# Altium schematic sheet FPGA.SchDoc
size 297 x 209 mm
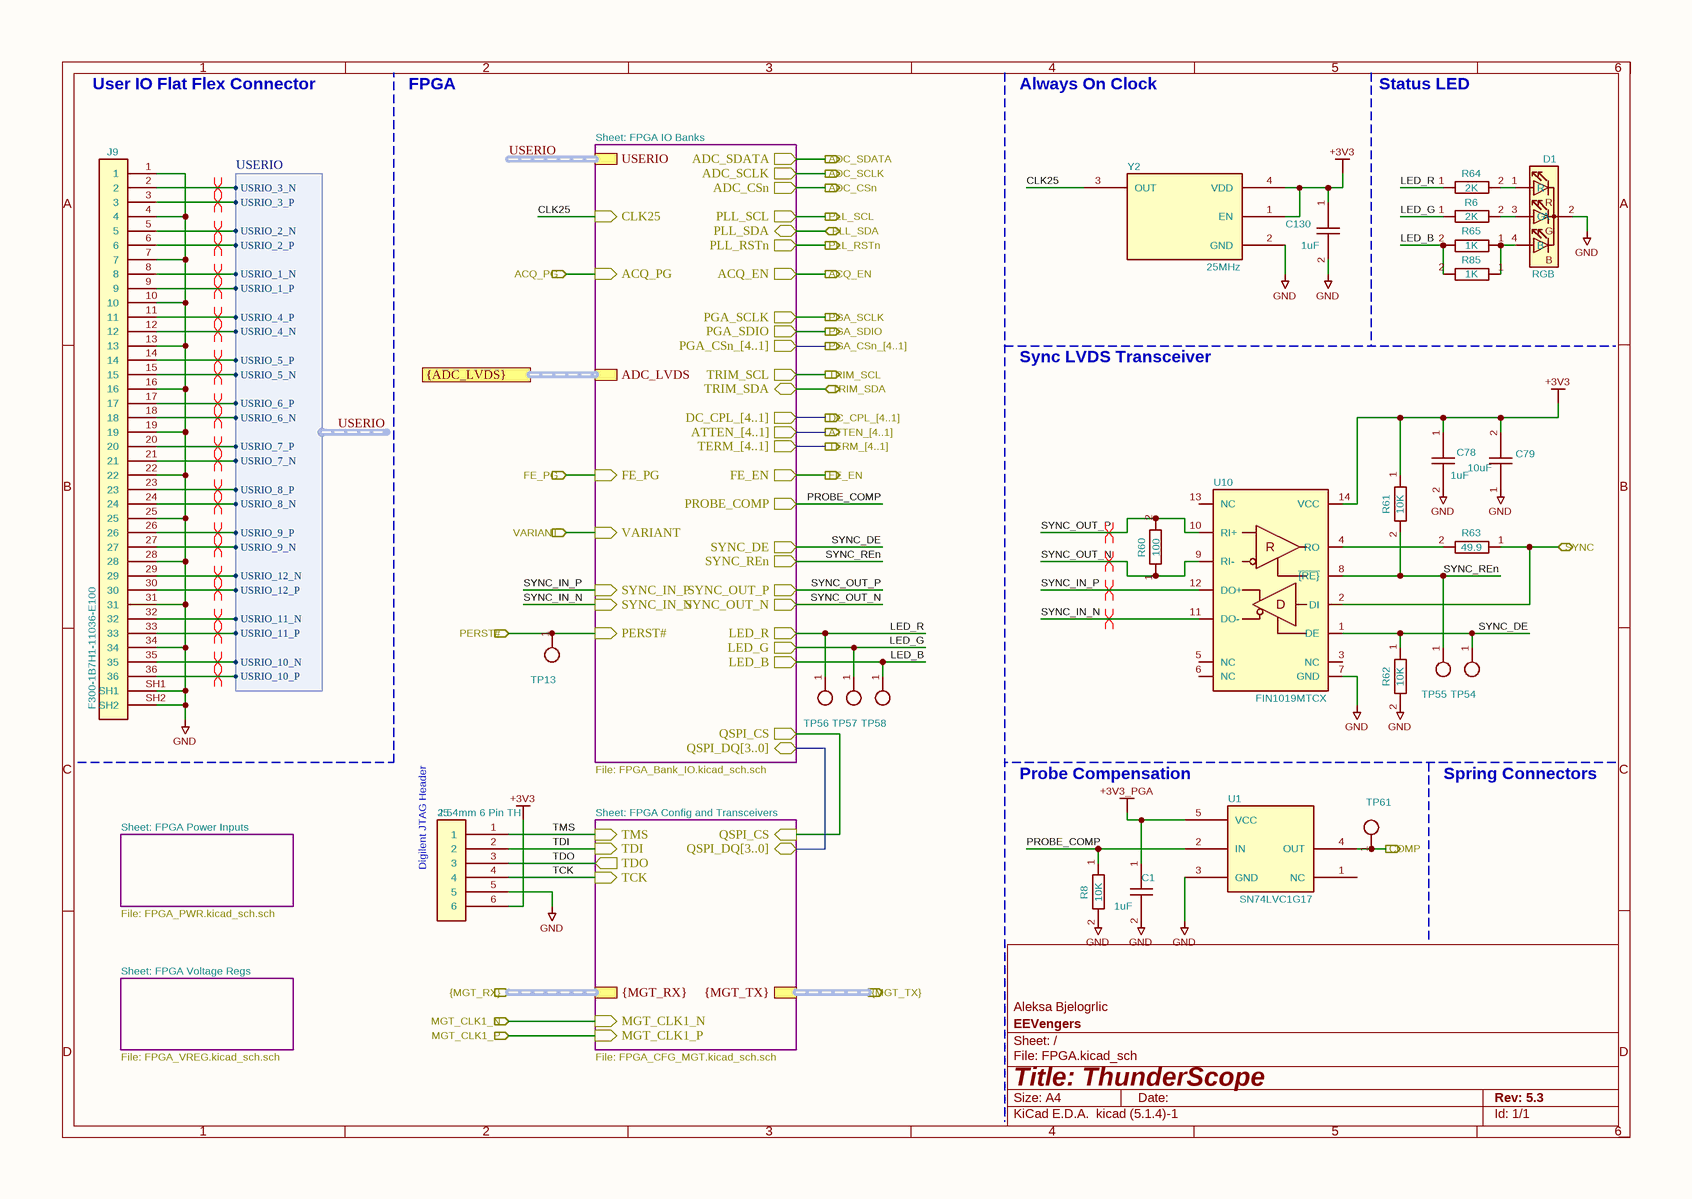
[diagram p0: FPGA.SchDoc]

## Parts
C1  1uF  [GEN_C_0402]
C78  1uF  [GEN_C_0402]
C79  10uF  [GEN_C_0603]
C130  1uF  [GEN_C_0402]
D1  RGB  [LED_Kingbright_APFA3010_3x1.5mm_Horizontal]
J5  2.54mm 6 Pin TH  [GEN_1.27MM_6_PIN_TH_RA]
J9  F300-1B7H1-11036-E100  [AMPHENOL_F300-1B7H1-11036-E100]
R6  2K  [GEN_R_0402]
R8  10K  [GEN_R_0402]
R60  100  [GEN_R_0402]
R61  10K  [GEN_R_0402]
R62  10K  [GEN_R_0402]
R63  49.9  [GEN_R_0402]
R64  2K  [GEN_R_0402]
R65  1K  [GEN_R_0402]
R85  1K  [GEN_R_0402]
TP13  PCB  [GEN_TP_PCB]  (value not drawn)
TP54  PCB  [GEN_TP_PCB]  (value not drawn)
TP55  PCB  [GEN_TP_PCB]  (value not drawn)
TP56  PCB  [GEN_TP_PCB]  (value not drawn)
TP57  PCB  [GEN_TP_PCB]  (value not drawn)
TP58  PCB  [GEN_TP_PCB]  (value not drawn)
TP61  PCB  [GEN_TP_PCB]  (value not drawn)
U1  SN74LVC1G17  [GEN_SC-70-5]
U10  FIN1019MTCX  [GEN_TSSOP-14_4.4x5mm_P0.65mm]
Y2  25MHz  [ECS_TXO-2016]

## Sub-sheets
FPGA Config and Transceivers = FPGA_CFG_MGT.SchDoc: TDI (in), TDO (out), TCK (in), TMS (in), QSPI_DQ[3..0] (bidir), QSPI_CS (in), MGT_CLK1_N (in), MGT_CLK1_P (in), {MGT_RX} (harness MGT_RX), {MGT_TX} (harness MGT_TX)
FPGA IO Banks = FPGA_Bank_IO.SchDoc: FE_EN (out), PROBE_COMP (out), PLL_RSTn (out), ATTEN_[4..1] (out), TERM_[4..1] (out), DC_CPL_[4..1] (out), PGA_CSn_[4..1] (out), ADC_CSn (out), PERST# (in), ADC_SDATA (out), ADC_SCLK (out), PLL_SCL (out), PLL_SDA (bidir), ACQ_EN (out), PGA_SCLK (out), PGA_SDIO (out), TRIM_SCL (out), TRIM_SDA (bidir), SYNC_OUT_N (out), SYNC_OUT_P (out), SYNC_IN_P (in), SYNC_IN_N (in), FE_PG (in), ACQ_PG (in), SYNC_DE (out), SYNC_REn (out), LED_R (out), LED_G (out), LED_B (out), CLK25 (in), QSPI_CS (out), QSPI_DQ[3..0] (bidir), VARIANT (in), USERIO (harness USERIO), ADC_LVDS (harness ADC_LVDS)
FPGA Power Inputs = FPGA_PWR.SchDoc: no entries
FPGA Voltage Regs = FPGA_VREG.SchDoc: no entries

## Ports
ACQ_EN (out), ACQ_PG (in), ADC_CSn (out), ADC_SCLK (out), ADC_SDATA (out), ATTEN_[4..1] (out), COMP (out), DC_CPL_[4..1] (out), FE_EN (out), FE_PG (in), MGT_CLK1_N (in), MGT_CLK1_P (in), PERST# (in), PGA_CSn_[4..1] (out), PGA_SCLK (out), PGA_SDIO (out), PLL_RSTn (out), PLL_SCL (out), PLL_SDA (bidir), SYNC (bidir), TERM_[4..1] (out), TRIM_SCL (out), TRIM_SDA (bidir), VARIANT (in), {ADC_LVDS}, {MGT_RX} (in), {MGT_TX} (out)

## Harnesses
USERIO: USRIO_1_P, USRIO_1_N, USRIO_2_P, USRIO_2_N, USRIO_3_P, USRIO_3_N, USRIO_4_P, USRIO_4_N, USRIO_5_P, USRIO_5_N, USRIO_6_P, USRIO_6_N, USRIO_7_P, USRIO_7_N, USRIO_8_P, USRIO_8_N, USRIO_9_P, USRIO_9_N, USRIO_10_P, USRIO_10_N, USRIO_11_P, USRIO_11_N, USRIO_12_P, USRIO_12_N

## Nets
+3V3: C78.1 C79.2 C130.1 J5.6 R61.1 U10.14(VCC) Y2.1(EN) Y2.4(VDD)
+3V3_PGA: C1.1 U1.5(VCC)
GND: C1.2 C78.2 C79.1 C130.2 D1.2(A) J5.5 J9.1 J9.4 J9.7 J9.10 J9.13 J9.16 J9.19 J9.22 J9.25 J9.28 J9.31 J9.34 J9.SH1 J9.SH2 R8.2 R62.2 U1.3(GND) U10.7(GND) Y2.2(GND)
ACQ_EN: port ACQ_EN, sheet FPGA IO Banks/ACQ_EN
ACQ_PG: port ACQ_PG, sheet FPGA IO Banks/ACQ_PG
ADC_CSn: port ADC_CSn, sheet FPGA IO Banks/ADC_CSn
ADC_SCLK: port ADC_SCLK, sheet FPGA IO Banks/ADC_SCLK
ADC_SDATA: port ADC_SDATA, sheet FPGA IO Banks/ADC_SDATA
CLK25: Y2.3(OUT) ; sheet FPGA IO Banks/CLK25
COMP: TP61.1 U1.4(OUT) ; port COMP
FE_EN: port FE_EN, sheet FPGA IO Banks/FE_EN
FE_PG: port FE_PG, sheet FPGA IO Banks/FE_PG
LED_B: R65.2 R85.2 TP58.1 ; sheet FPGA IO Banks/LED_B
LED_G: R6.1 TP57.1 ; sheet FPGA IO Banks/LED_G
LED_R: R64.1 TP56.1 ; sheet FPGA IO Banks/LED_R
MGT_CLK1_N: port MGT_CLK1_N, sheet FPGA Config and Transceivers/MGT_CLK1_N
MGT_CLK1_P: port MGT_CLK1_P, sheet FPGA Config and Transceivers/MGT_CLK1_P
PERST#: TP13.1 ; port PERST#, sheet FPGA IO Banks/PERST#
PGA_SCLK: port PGA_SCLK, sheet FPGA IO Banks/PGA_SCLK
PGA_SDIO: port PGA_SDIO, sheet FPGA IO Banks/PGA_SDIO
PLL_RSTn: port PLL_RSTn, sheet FPGA IO Banks/PLL_RSTn
PLL_SCL: port PLL_SCL, sheet FPGA IO Banks/PLL_SCL
PLL_SDA: port PLL_SDA, sheet FPGA IO Banks/PLL_SDA
PROBE_COMP: R8.1 U1.2(IN) ; sheet FPGA IO Banks/PROBE_COMP
SYNC: R63.1 U10.2(DI) ; port SYNC
SYNC_DE: R62.1 TP54.1 U10.1(DE) ; sheet FPGA IO Banks/SYNC_DE
SYNC_IN_N: U10.11(DO-) ; sheet FPGA IO Banks/SYNC_IN_N
SYNC_IN_P: U10.12(DO+) ; sheet FPGA IO Banks/SYNC_IN_P
SYNC_OUT_N: R60.1 U10.9(RI-) ; sheet FPGA IO Banks/SYNC_OUT_N
SYNC_OUT_P: R60.2 U10.10(RI+) ; sheet FPGA IO Banks/SYNC_OUT_P
SYNC_REn: R61.2 TP55.1 U10.8(~{{RE}}) ; sheet FPGA IO Banks/SYNC_REn
TCK: J5.4 ; sheet FPGA Config and Transceivers/TCK
TDI: J5.2 ; sheet FPGA Config and Transceivers/TDI
TDO: J5.3 ; sheet FPGA Config and Transceivers/TDO
TMS: J5.1 ; sheet FPGA Config and Transceivers/TMS
TRIM_SCL: port TRIM_SCL, sheet FPGA IO Banks/TRIM_SCL
TRIM_SDA: port TRIM_SDA, sheet FPGA IO Banks/TRIM_SDA
USERIO.USRIO_1_N: J9.8 ; sheet FPGA IO Banks/USERIO.USRIO_1_N
USERIO.USRIO_1_P: J9.9 ; sheet FPGA IO Banks/USERIO.USRIO_1_P
USERIO.USRIO_2_N: J9.5 ; sheet FPGA IO Banks/USERIO.USRIO_2_N
USERIO.USRIO_2_P: J9.6 ; sheet FPGA IO Banks/USERIO.USRIO_2_P
USERIO.USRIO_3_N: J9.2 ; sheet FPGA IO Banks/USERIO.USRIO_3_N
USERIO.USRIO_3_P: J9.3 ; sheet FPGA IO Banks/USERIO.USRIO_3_P
USERIO.USRIO_4_N: J9.12 ; sheet FPGA IO Banks/USERIO.USRIO_4_N
USERIO.USRIO_4_P: J9.11 ; sheet FPGA IO Banks/USERIO.USRIO_4_P
USERIO.USRIO_5_N: J9.15 ; sheet FPGA IO Banks/USERIO.USRIO_5_N
USERIO.USRIO_5_P: J9.14 ; sheet FPGA IO Banks/USERIO.USRIO_5_P
USERIO.USRIO_6_N: J9.18 ; sheet FPGA IO Banks/USERIO.USRIO_6_N
USERIO.USRIO_6_P: J9.17 ; sheet FPGA IO Banks/USERIO.USRIO_6_P
USERIO.USRIO_7_N: J9.21 ; sheet FPGA IO Banks/USERIO.USRIO_7_N
USERIO.USRIO_7_P: J9.20 ; sheet FPGA IO Banks/USERIO.USRIO_7_P
USERIO.USRIO_8_N: J9.24 ; sheet FPGA IO Banks/USERIO.USRIO_8_N
USERIO.USRIO_8_P: J9.23 ; sheet FPGA IO Banks/USERIO.USRIO_8_P
USERIO.USRIO_9_N: J9.27 ; sheet FPGA IO Banks/USERIO.USRIO_9_N
USERIO.USRIO_9_P: J9.26 ; sheet FPGA IO Banks/USERIO.USRIO_9_P
USERIO.USRIO_10_N: J9.35 ; sheet FPGA IO Banks/USERIO.USRIO_10_N
USERIO.USRIO_10_P: J9.36 ; sheet FPGA IO Banks/USERIO.USRIO_10_P
USERIO.USRIO_11_N: J9.32 ; sheet FPGA IO Banks/USERIO.USRIO_11_N
USERIO.USRIO_11_P: J9.33 ; sheet FPGA IO Banks/USERIO.USRIO_11_P
USERIO.USRIO_12_N: J9.29 ; sheet FPGA IO Banks/USERIO.USRIO_12_N
USERIO.USRIO_12_P: J9.30 ; sheet FPGA IO Banks/USERIO.USRIO_12_P
VARIANT: port VARIANT, sheet FPGA IO Banks/VARIANT
NetD1_1: D1.1(R) R64.2
NetD1_3: D1.3(G) R6.2
NetD1_4: D1.4(B) R65.1 R85.1
NetR63_2: R63.2 U10.4(RO)
(unnamed): sheet FPGA IO Banks/QSPI_CS, sheet FPGA Config and Transceivers/QSPI_CS

Not connected (* = marked no-connect by the designer): U1 1(NC); U10 3(NC) 5(NC) 6(NC) 13(NC)

## Buses and harness runs
bus port ATTEN_[4..1] = sheet FPGA IO Banks/ATTEN_[4..1]
bus port DC_CPL_[4..1] = sheet FPGA IO Banks/DC_CPL_[4..1]
bus port PGA_CSn_[4..1] = sheet FPGA IO Banks/PGA_CSn_[4..1]
bus port TERM_[4..1] = sheet FPGA IO Banks/TERM_[4..1]
bus sheet FPGA Config and Transceivers/QSPI_DQ[3..0] = sheet FPGA IO Banks/QSPI_DQ[3..0]
harness port {ADC_LVDS} = sheet FPGA IO Banks/ADC_LVDS
harness port {MGT_RX} = sheet FPGA Config and Transceivers/{MGT_RX}
harness port {MGT_TX} = sheet FPGA Config and Transceivers/{MGT_TX}
harness USERIO = sheet FPGA IO Banks/USERIO

## Layout directives
differential pair: SYNC_IN_N, SYNC_IN_P, SYNC_OUT_N, SYNC_OUT_P
differential pair; differential pair class USERIO: USERIO.USRIO_1_N, USERIO.USRIO_1_P, USERIO.USRIO_2_N, USERIO.USRIO_2_P, USERIO.USRIO_3_N, USERIO.USRIO_3_P, USERIO.USRIO_4_N, USERIO.USRIO_4_P, USERIO.USRIO_5_N, USERIO.USRIO_5_P, USERIO.USRIO_6_N, USERIO.USRIO_6_P, USERIO.USRIO_7_N, USERIO.USRIO_7_P, USERIO.USRIO_8_N, USERIO.USRIO_8_P, USERIO.USRIO_9_N, USERIO.USRIO_9_P, USERIO.USRIO_10_N, USERIO.USRIO_10_P, USERIO.USRIO_11_N, USERIO.USRIO_11_P, USERIO.USRIO_12_N, USERIO.USRIO_12_P

## Notes on the sheet
- User IO Flat Flex Connector
- FPGA
- Sheet: FPGA IO Banks
- Always On Clock
- Status LED
- Sync LVDS Transceiver
- File: FPGA_Bank_IO.kicad_sch.sch
- Probe Compensation
- Spring Connectors
- Sheet: FPGA Power Inputs
- Sheet: FPGA Config and Transceivers
- File: FPGA_PWR.kicad_sch.sch
- (near J5) Digilent JTAG Header
- Sheet: FPGA Voltage Regs
- File: FPGA_VREG.kicad_sch.sch
- File: FPGA_CFG_MGT.kicad_sch.sch
- 1
- 2
- 3
- 4
- 5
- 6
- A
- B
- C
- Aleksa Bjelogrlic
- D
- Title: ThunderScope
- File: FPGA.kicad_sch
- Sheet: /
- EEVengers
- KiCad E.D.A.  kicad (5.1.4)-1
- Size: A4
- Date:
- Rev: 5.3
- Id: 1/1
- (in symbol IC LVDS XCVR FIN1019MTCX) R; D

## Library data of the parts
C1 C78 C130 = CAP 1uF 25V X5R 0402: MANUFACTURER: Murata; MANUFACTURER PART NUMBER: GRM155R61E105KA12D; VOLTAGE RATING: 25V; Substitutions Policy: Any Parametric Equivalent; PACKAGE: 0402; SUPPLIER 1: Mouser; SUPPLIER PART NUMBER 1: 81-GRM155R61E105KA2D; Footprint: Thunderscope_Rev5:GEN_C_0402; Value: 1uF
C79 = CAP 10uF 25V X5R 0603: MANUFACTURER: Murata; MANUFACTURER PART NUMBER: GRM188R61E106MA73D; VOLTAGE RATING: 25V; Substitutions Policy: Any Parametric Equivalent; PACKAGE: 0402; SUPPLIER 1: Mouser; SUPPLIER PART NUMBER 1: 81-GRM188R61E106MA3D; Footprint: Thunderscope_Rev5:GEN_C_0603; Value: 10uF
D1 = LED RGB 1204 APFA3010LSEKJ3ZGKQBC: A-SP1103R6GHB1W-A01-2C; MANUFACTURER: Kingbright; Substitutions Policy: ECO Required for Substitution; SUPPLIER 1: Mouser; SUPPLIER PART NUMBER 1: 604-APFA3010LSEKJ3ZG; MANUFACTURER PART NUMBER: APFA3010LSEKJ3ZGKQBC; PACKAGE: 4-SMD; Value: RGB; Footprint: Thunderscope_Rev5:LED_Kingbright_APFA3010_3x1.5mm_Horizontal
J5 = CONN 2.54mm 6 Pin TH RA: MANUFACTURER: Wurth Electronics; MANUFACTURER PART NUMBER: 61300611021; Substitutions Policy: ECO Required for Substitution; SUPPLIER 1: Mouser; SUPPLIER PART NUMBER 1: 710-61300611021; PACKAGE: Through Hole; Value: 2.54mm 6 Pin TH; Footprint: Thunderscope_Rev5:GEN_2.54MM_6_PIN_TH_RA
J9 = CONN FFC BOTTOM 36POS 0.5MM RA: MANUFACTURER: Amphenol ICC; Substitutions Policy: No Substitutions; SUPPLIER 1: Mouser; SUPPLIER PART NUMBER 1: 649-F3001B7H111036E1; MANUFACTURER PART NUMBER: F300-1B7H1-11036-E100; PACKAGE: Surface Mount; Footprint: Thunderscope_Rev5:AMPHENOL_F300-1B7H1-11036-E100; Value: F300-1B7H1-11036-E100
R6 R64 = RES 2K OHM 1% 1/16W 0402: MANUFACTURER: Yageo; MANUFACTURER PART NUMBER: RC0402FR-072KL; TOLERANCE: 1%; Substitutions Policy: Any Parametric Equivalent; PACKAGE: 0402; SUPPLIER 1: Mouser; SUPPLIER PART NUMBER 1: 603-RC0402FR-072KL; Footprint: Thunderscope_Rev5:GEN_R_0402; Value: 2K
R8 R61 R62 = RES 10K OHM 1% 1/16W 0402: MANUFACTURER: Yageo; MANUFACTURER PART NUMBER: RC0402FR-0710KL; TOLERANCE: 1%; Substitutions Policy: Any Parametric Equivalent; PACKAGE: 0402; SUPPLIER 1: Mouser; SUPPLIER PART NUMBER 1: 603-RC0402FR-0710KL; Footprint: Thunderscope_Rev5:GEN_R_0402; Value: 10K
R60 = RES 100 OHM 1% 1/10W 0402: MANUFACTURER: Yageo; MANUFACTURER PART NUMBER: RC0402FR-07100RL; TOLERANCE: 1%; Substitutions Policy: Any Parametric Equivalent; PACKAGE: 0402; SUPPLIER 1: Mouser; SUPPLIER PART NUMBER 1: 603-RC0402FR-07100RL; Footprint: Thunderscope_Rev5:GEN_R_0402; Value: 100
R63 = RES 49.9 OHM 1% 1/10W 0402: MANUFACTURER: Yageo; MANUFACTURER PART NUMBER: RC0402FR-0749R9L; TOLERANCE: 1%; Substitutions Policy: Any Parametric Equivalent; PACKAGE: 0402; SUPPLIER 1: Mouser; SUPPLIER PART NUMBER 1: 603-RC0402FR-0749R9L; Footprint: Thunderscope_Rev5:GEN_R_0402; Value: 49.9
R65 R85 = RES 1K OHM 1% 1/10W 0402: HOUSE PART NUMBER: R-1K-0402-1%-001; MANUFACTURER: Yageo; MANUFACTURER PART NUMBER: RC0402FR-071KL; TOLERANCE: 1%; Substitutions Policy: Any Parametric Equivalent; PACKAGE: 0402; SUPPLIER 1: Mouser; SUPPLIER PART NUMBER 1: 603-RC0402FR-071KL; Footprint: Thunderscope_Rev5:GEN_R_0402; Value: 1K
TP13 TP54-TP58 TP61 = TP PCB 1mm: Footprint: Thunderscope_Rev5:GEN_TP_PCB; Value: PCB
U1 = IC BUFFER SN74LVC1G17: MANUFACTURER: Texas Instruments; MANUFACTURER PART NUMBER: SN74LVC1G17DCKR; Substitutions Policy: ECO Required for Substitution; SUPPLIER 1: Texas Instruments; SUPPLIER PART NUMBER 1: SN74LVC1G17DCKR; PACKAGE: SC-70-5; Value: SN74LVC1G17; Footprint: Thunderscope_Rev5:GEN_SC-70-5
U10 = IC LVDS XCVR FIN1019MTCX: MANUFACTURER: onsemi; Substitutions Policy: No Substitutions; SUPPLIER 1: Mouser; SUPPLIER PART NUMBER 1: 512-FIN1019MTCX; MANUFACTURER PART NUMBER: FIN1019MTCX; PACKAGE: 14-TSSOP; Value: FIN1019MTCX; Footprint: Thunderscope_Rev5:GEN_TSSOP-14_4.4x5mm_P0.65mm
Y2 = OSC 25MHz ECS-TXO-2016: HOUSE PART NUMBER: ECS-TXO-2016-33-250-TR; MANUFACTURER: ECS International; Substitutions Policy: ECO Required for Substitution; SUPPLIER 1: Mouser; SUPPLIER PART NUMBER 1: 520-TXO-2016-33-250T; MANUFACTURER PART NUMBER: ECS-TXO-2016-33-250-TR; PACKAGE: 4-SMD (2.0x1.6mm); Value: 25MHz; Footprint: Thunderscope_Rev5:ECS_TXO-2016